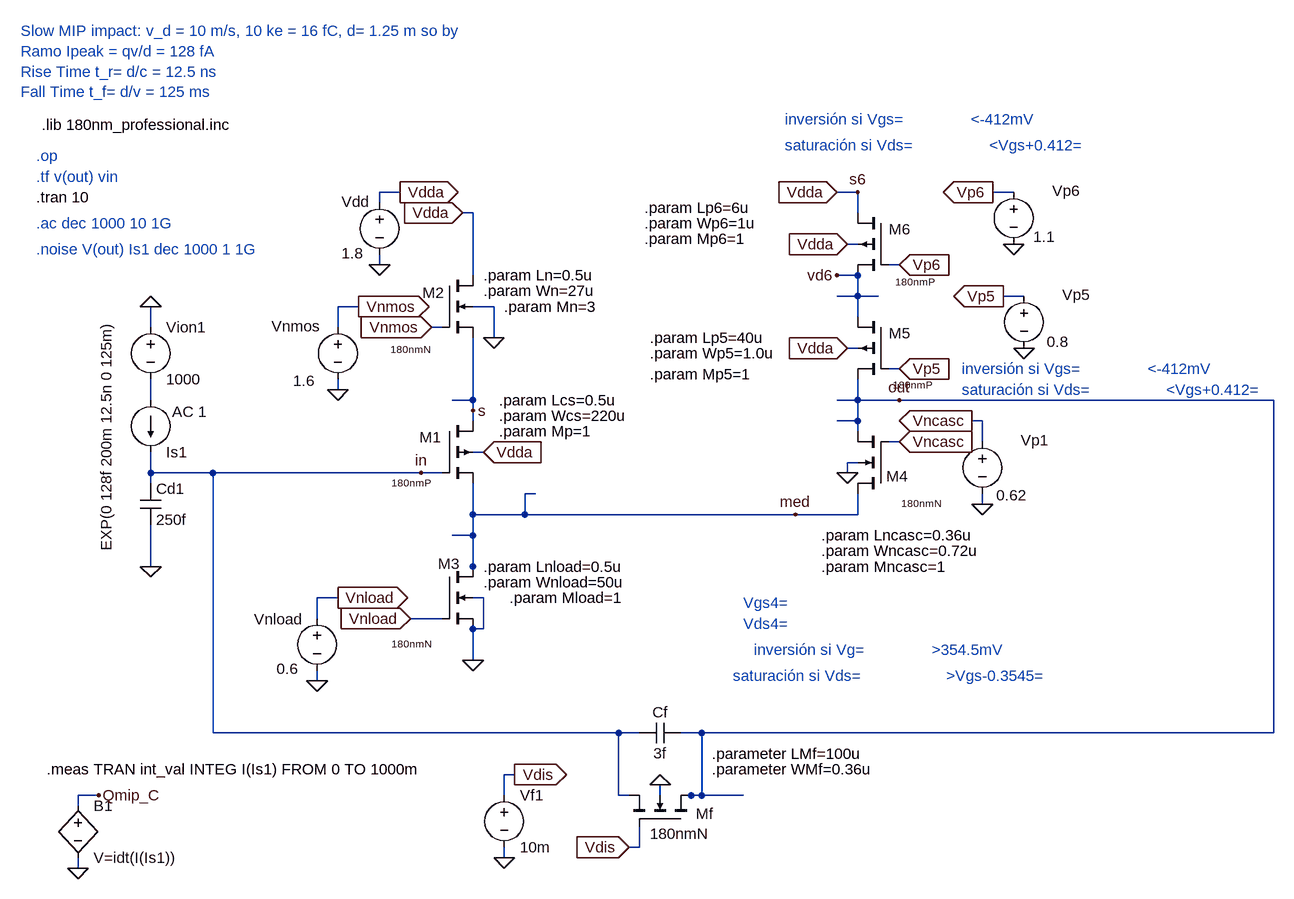
[diagram p0: schematic CSAfolded180nm.asc]
CSAfolded180nm.asc, the LTspice schematic file:
Version 4.1
SHEET 1 1220 840
WIRE -304 -240 -336 -240
WIRE 400 -240 368 -240
WIRE 640 -240 608 -240
WIRE -336 -224 -336 -240
WIRE -192 -208 -208 -208
WIRE 400 -208 400 -240
WIRE 400 -160 384 -160
WIRE -336 -128 -336 -144
WIRE 464 -128 448 -128
WIRE -192 -112 -192 -208
WIRE 400 -112 368 -112
WIRE 400 -80 400 -112
WIRE 400 -80 368 -80
WIRE 432 -80 400 -80
WIRE 656 -80 624 -80
WIRE -368 -64 -400 -64
WIRE -160 -64 -192 -64
WIRE 400 -48 400 -80
WIRE -688 -32 -688 -64
WIRE -400 -32 -400 -64
WIRE -240 -32 -256 -32
WIRE -160 -16 -160 -64
WIRE 400 0 384 0
WIRE 464 32 448 32
WIRE -400 64 -400 48
WIRE -688 80 -688 48
WIRE -192 80 -192 -16
WIRE -192 80 -224 80
WIRE 400 80 400 48
WIRE 400 80 368 80
WIRE 464 80 400 80
WIRE 1040 80 464 80
WIRE -192 96 -192 80
WIRE -192 112 -192 96
WIRE 400 112 400 80
WIRE 400 112 368 112
WIRE 592 112 576 112
WIRE 400 128 400 112
WIRE 464 144 448 144
WIRE 592 144 592 112
WIRE -176 160 -192 160
WIRE 400 176 384 176
WIRE -688 192 -688 160
WIRE -592 192 -688 192
WIRE -272 192 -592 192
WIRE -240 192 -272 192
WIRE 384 192 384 176
WIRE -688 208 -688 192
WIRE -96 224 -112 224
WIRE 592 240 592 224
WIRE -192 256 -192 208
WIRE -112 256 -112 224
WIRE -112 256 -192 256
WIRE 304 256 -112 256
WIRE 400 256 400 224
WIRE 400 256 304 256
WIRE -192 288 -192 256
WIRE -192 288 -224 288
WIRE -688 336 -688 272
WIRE -192 336 -192 288
WIRE -192 352 -192 336
WIRE -400 384 -432 384
WIRE -176 384 -192 384
WIRE -432 416 -432 384
WIRE -240 416 -288 416
WIRE -176 432 -176 384
WIRE -176 432 -192 432
WIRE -192 480 -192 432
WIRE -432 512 -432 496
WIRE -592 592 -592 192
WIRE 32 592 -592 592
WIRE 64 592 32 592
WIRE 160 592 128 592
WIRE 1040 592 1040 80
WIRE 1040 592 160 592
WIRE -128 656 -144 656
WIRE -768 688 -800 688
WIRE -144 688 -144 656
WIRE 32 688 32 592
WIRE 48 688 32 688
WIRE 96 688 96 672
WIRE 144 688 128 688
WIRE 160 688 160 592
WIRE 160 688 144 688
WIRE 224 688 160 688
WIRE -800 704 -800 688
WIRE 64 768 64 736
WIRE 64 768 48 768
WIRE -144 784 -144 768
WIRE -800 800 -800 784
FLAG -192 480 0
FLAG -336 -128 0
FLAG -304 -240 Vdda
IOPIN -304 -240 Out
FLAG -208 -208 Vdda
IOPIN -208 -208 In
FLAG 304 256 med
FLAG -272 192 in
FLAG -400 64 0
FLAG -368 -64 Vnmos
IOPIN -368 -64 Out
FLAG -256 -32 Vnmos
IOPIN -256 -32 In
FLAG -160 -16 0
FLAG -176 160 Vdda
IOPIN -176 160 In
FLAG -192 96 s
FLAG -288 416 Vnload
IOPIN -288 416 In
FLAG -432 512 0
FLAG -400 384 Vnload
IOPIN -400 384 Out
FLAG 464 144 Vncasc
IOPIN 464 144 In
FLAG 384 192 0
FLAG 464 32 Vp5
IOPIN 464 32 In
FLAG 384 0 Vdda
IOPIN 384 0 In
FLAG 464 -128 Vp6
IOPIN 464 -128 In
FLAG 384 -160 Vdda
IOPIN 384 -160 In
FLAG 368 -240 Vdda
IOPIN 368 -240 In
FLAG 640 -160 0
FLAG 608 -240 Vp6
IOPIN 608 -240 Out
FLAG 656 0 0
FLAG 624 -80 Vp5
IOPIN 624 -80 Out
FLAG 592 240 0
FLAG 576 112 Vncasc
IOPIN 576 112 Out
FLAG 464 80 out
FLAG 368 -112 vd6
FLAG 400 -240 s6
FLAG 48 768 Vdis
IOPIN 48 768 In
FLAG 96 672 0
FLAG -128 656 Vdis
IOPIN -128 656 Out
FLAG -144 784 0
FLAG -688 336 0
FLAG -688 -64 0
FLAG -800 800 0
FLAG -768 688 Qmip_C
DATAFLAG -208 80 "round(1e3*V(s))/1e3"
DATAFLAG -224 288 "round(1e7*Id(M3))/1e7"
DATAFLAG 368 80 "round(1e6*V(out)/Id(M4))/1e6"
DATAFLAG 368 -80 "round(1e8*Id(M5))/1e8"
DATAFLAG 432 -80 "round(1e4*v(vd6))/1e4"
DATAFLAG -96 224 "round(1e4*v(med))/1e4"
DATAFLAG 368 112 "round(1e4*v(out))/1e4"
DATAFLAG 384 432 "round(1e5*(v(out)-v(med)))/1e5"
DATAFLAG 352 400 "round(1e3*(v(vncasc)-v(med)))/1e3"
DATAFLAG 816 512 "round(1e4*(v(vncasc)-v(med)-0.3545))/1e4"
DATAFLAG 480 512 "round(1e5*(v(out)-v(med)))/1e5"
DATAFLAG 480 464 "round(1e4*(v(vncasc)))/1e4"
DATAFLAG 1104 80 "round(1e4*(v(vp5)-v(vd6)+0.412))/1e4"
DATAFLAG 816 64 "round(1e6*(v(out)-v(vd6)))/1e6"
DATAFLAG 816 32 "round(1e4*(v(vp5)-v(vd6)))/1e4"
DATAFLAG 560 -304 "round(1e3*(v(vd6)-1.8))/1e3"
DATAFLAG 544 -352 "round(1e4*(v(vp6)-1.8))/1e4"
DATAFLAG 848 -304 "round(1e4*(0.412+v(vp6)-1.8))/1e4"
DATAFLAG 224 688 "round(1e15*Id(Mf))/1e15"
DATAFLAG -416 192 ""
SYMBOL pmos4 -240 112 R0
WINDOW 0 -34 25 Left 2
WINDOW 3 -77 95 Left 1
SYMATTR InstName M1
SYMATTR Value 180nmP
SYMATTR Value2 l={Lcs} w={Wcs} m={Mp}
SYMBOL voltage -336 -240 R0
WINDOW 123 0 0 Left 0
WINDOW 39 0 0 Left 0
WINDOW 0 -58 15 Left 2
WINDOW 3 -58 94 Left 2
SYMATTR InstName Vdd
SYMATTR Value 1.8
SYMBOL nmos4 -240 -112 R0
WINDOW 0 -30 27 Left 2
WINDOW 3 -79 114 Left 1
SYMATTR InstName M2
SYMATTR Value 180nmN
SYMATTR Value2 l={Ln} w={Wn} m={Mn}
SYMBOL voltage -400 -48 R0
WINDOW 123 0 0 Left 0
WINDOW 39 0 0 Left 0
WINDOW 0 -102 14 Left 2
WINDOW 3 -69 98 Left 2
SYMATTR InstName Vnmos
SYMATTR Value 1.6
SYMBOL nmos4 -240 336 R0
WINDOW 0 -6 -4 Left 2
WINDOW 3 -77 119 Left 1
SYMATTR InstName M3
SYMATTR Value 180nmN
SYMATTR Value2 l={Lnload} w={Wnload} m={Mload}
SYMBOL voltage -432 400 R0
WINDOW 123 0 0 Left 0
WINDOW 39 0 0 Left 0
WINDOW 0 -97 17 Left 2
WINDOW 3 -62 93 Left 2
SYMATTR InstName Vnload
SYMATTR Value 0.6
SYMBOL nmos4 448 224 R180
WINDOW 0 -30 27 Left 2
WINDOW 3 -80 -15 Left 1
SYMATTR InstName M4
SYMATTR Value 180nmN
SYMATTR Value2 l={Lncasc} w={Wncasc} m={Mncasc}
SYMBOL pmos4 448 -48 M0
WINDOW 0 -34 25 Left 2
WINDOW 3 -66 104 Left 1
SYMATTR InstName M5
SYMATTR Value 180nmP
SYMATTR Value2 l={Lcs} w={Wcs} m={Mp}
SYMBOL pmos4 448 -208 M0
WINDOW 0 -34 25 Left 2
WINDOW 3 -70 106 Left 1
SYMATTR InstName M6
SYMATTR Value 180nmP
SYMATTR Value2 l={Lp6} w={Wp6} m={Mp6}
SYMBOL voltage 640 -256 M0
WINDOW 123 0 0 Left 0
WINDOW 39 0 0 Left 0
WINDOW 0 -102 14 Left 2
WINDOW 3 -64 85 Left 2
SYMATTR InstName Vp6
SYMATTR Value 1.1
SYMBOL voltage 656 -96 M0
WINDOW 123 0 0 Left 0
WINDOW 39 0 0 Left 0
WINDOW 0 -102 14 Left 2
WINDOW 3 -69 86 Left 2
SYMATTR InstName Vp5
SYMATTR Value 0.8
SYMBOL voltage 592 128 M0
WINDOW 123 0 0 Left 0
WINDOW 39 0 0 Left 0
WINDOW 0 -102 14 Left 2
WINDOW 3 -69 98 Left 2
SYMATTR InstName Vp1
SYMATTR Value 0.62
SYMBOL cap 128 576 R90
WINDOW 0 0 32 VBottom 2
WINDOW 3 32 32 VTop 2
SYMATTR InstName Cf
SYMATTR Value 3f
SYMBOL nmos4 144 736 M270
WINDOW 0 20 -7 VLeft 2
WINDOW 3 -11 64 VLeft 2
SYMATTR InstName Mf
SYMATTR Value 180nmN
SYMATTR Value2 l={LMf} w={WMf} m=1
SYMBOL voltage -144 672 R0
WINDOW 123 0 0 Left 0
WINDOW 39 0 0 Left 0
SYMATTR InstName Vf1
SYMATTR Value 10m
SYMBOL current -688 80 R0
WINDOW 0 24 80 Left 2
WINDOW 3 -68 -122 VRight 2
WINDOW 123 33 18 Left 2
WINDOW 39 0 0 Left 2
SYMATTR InstName Is1
SYMATTR Value EXP(0 128f 200m 12.5n 0 125m)
SYMATTR Value2 AC 1
SYMBOL cap -704 208 R0
SYMATTR InstName Cd1
SYMATTR Value 250f
SYMBOL voltage -688 -48 R0
SYMATTR InstName Vion1
SYMATTR Value 1000
SYMBOL bv -800 688 R0
SYMATTR InstName B1
SYMATTR Value V=idt(I(Is1))
TEXT -856 -344 Left 2 !.lib 180nm_professional.inc
TEXT -152 80 Left 2 !.param Lcs=0.5u
TEXT -152 104 Left 2 !.param Wcs=220u
TEXT -864 -232 Left 2 !.tran 10
TEXT -864 -296 Left 2 ;.op
TEXT -864 -264 Left 2 ;.tf v(out) vin
TEXT -176 -112 Left 2 !.param Ln=0.5u
TEXT -176 -88 Left 2 !.param Wn=27u
TEXT -176 336 Left 2 !.param Lnload=0.5u
TEXT -176 360 Left 2 !.param Wnload=50u
TEXT -144 -64 Left 2 !.param Mn=3
TEXT -152 128 Left 2 !.param Mp=1
TEXT -136 384 Left 2 !.param Mload=1
TEXT 72 -216 Left 2 !.param Lp6=6u
TEXT 72 -192 Left 2 !.param Wp6=1u
TEXT 72 -168 Left 2 !.param Mp6=1
TEXT 80 -16 Left 2 !.param Lp5=40u
TEXT 80 8 Left 2 !.param Wp5=1.0u
TEXT 80 40 Left 2 !.param Mp5=1
TEXT 344 288 Left 2 !.param Lncasc=0.36u
TEXT 344 312 Left 2 !.param Wncasc=0.72u
TEXT 344 336 Left 2 !.param Mncasc=1
TEXT 224 392 Left 2 ;Vgs4=
TEXT 224 424 Left 2 ;Vds4=
TEXT 240 464 Left 2 ;inversión si Vg=               >354.5mV
TEXT 208 504 Left 2 ;saturación si Vds=                   >Vgs-0.3545=
TEXT 560 32 Left 2 ;inversión si Vgs=               <-412mV
TEXT 560 64 Left 2 ;saturación si Vds=                 <Vgs+0.412=
TEXT 288 -352 Left 2 ;inversión si Vgs=               <-412mV
TEXT 288 -312 Left 2 ;saturación si Vds=                 <Vgs+0.412=
TEXT 176 648 Left 2 !.parameter WMf=0.36u
TEXT 176 624 Left 2 !.parameter LMf=100u
TEXT -888 -488 Left 2 ;Slow MIP impact: v_d = 10 m/s, 10 ke = 16 fC, d= 1.25 m so by\nRamo Ipeak = qv/d = 128 fA\nRise Time t_r= d/c = 12.5 ns\nFall Time t_f= d/v = 125 ms
TEXT -848 648 Left 2 !.meas TRAN int_val INTEG I(Is1) FROM 0 TO 1000m
TEXT -864 -192 Left 2 ;.ac dec 1000 10 1G
TEXT -864 -152 Left 2 ;.noise V(out) Is1 dec 1000 1 1G

The netlist it stands for:
* CSAfolded180nm.asc
M1 s in med s6 180nmP l={Lcs} w={Wcs} m={Mp}
Vdd s6 0 1.8
M2 s6 Vnmos s 0 180nmN l={Ln} w={Wn} m={Mn}
Vnmos Vnmos 0 1.6
M3 med Vnload 0 0 180nmN l={Lnload} w={Wnload} m={Mload}
Vnload Vnload 0 0.6
M4 med Vncasc out 0 180nmN l={Lncasc} w={Wncasc} m={Mncasc}
M5 vd6 Vp5 out s6 180nmP l={Lcs} w={Wcs} m={Mp}
M6 s6 Vp6 vd6 s6 180nmP l={Lp6} w={Wp6} m={Mp6}
Vp6 Vp6 0 1.1
Vp5 Vp5 0 0.8
Vp1 Vncasc 0 0.62
Cf out in 3f
Mf out Vdis in 0 180nmN l={LMf} w={WMf} m=1
Vf1 Vdis 0 10m
Is1 N001 in EXP(0 128f 200m 12.5n 0 125m) AC 1
Cd1 in 0 250f
Vion1 0 N001 1000
B1 Qmip_C 0 V=idt(I(Is1))
.model NMOS NMOS
.model PMOS PMOS
.lib standard.mos
.lib 180nm_professional.inc
.param Lcs=0.5u
.param Wcs=220u
.tran 10
* .op
* .tf v(out) vin
.param Ln=0.5u
.param Wn=27u
.param Lnload=0.5u
.param Wnload=50u
.param Mn=3
.param Mp=1
.param Mload=1
.param Lp6=6u
.param Wp6=1u
.param Mp6=1
.param Lp5=40u
.param Wp5=1.0u
.param Mp5=1
.param Lncasc=0.36u
.param Wncasc=0.72u
.param Mncasc=1
* Vgs4=
* Vds4=
* inversión si Vg=               >354.5mV
* saturación si Vds=                   >Vgs-0.3545=
* inversión si Vgs=               <-412mV
* saturación si Vds=                 <Vgs+0.412=
* inversión si Vgs=               <-412mV
* saturación si Vds=                 <Vgs+0.412=
.parameter WMf=0.36u
.parameter LMf=100u
* Slow MIP impact: v_d = 10 m/s, 10 ke = 16 fC, d= 1.25 m so by
* Ramo Ipeak = qv/d = 128 fA
* Rise Time t_r= d/c = 12.5 ns
* Fall Time t_f= d/v = 125 ms
.meas TRAN int_val INTEG I(Is1) FROM 0 TO 1000m
* .ac dec 1000 10 1G
* .noise V(out) Is1 dec 1000 1 1G
.backanno
.end